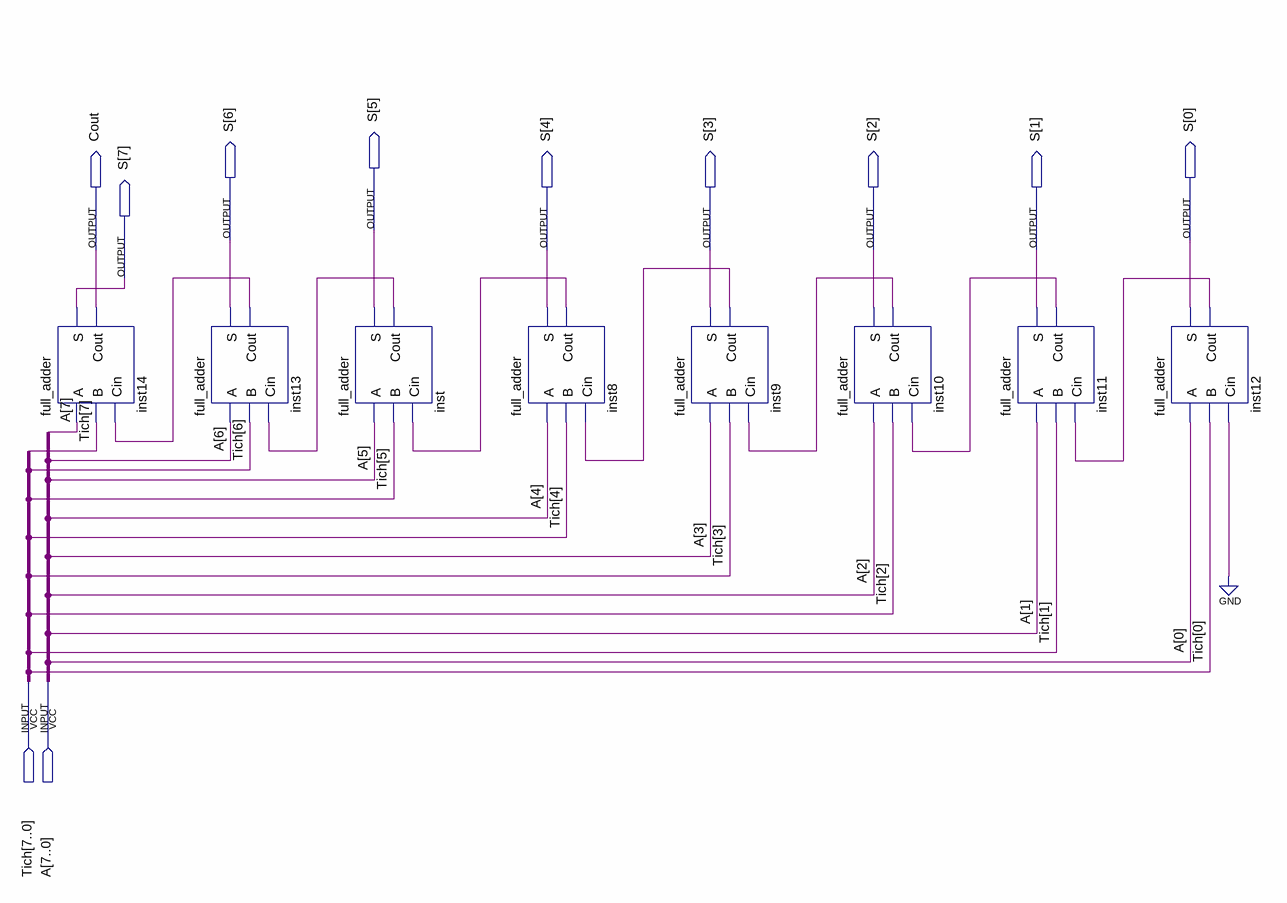
[diagram p0: schematic sheet]
// Quartus schematic full_adder_8bit.bdf as structural Verilog: 8 symbols, 11 pins
module full_adder_8bit (
  input  [7:0] Tich,
  input  [7:0] A,
  output [7:0] S,
  output Cout
);

  wire inst8_cout, inst9_cout, inst10_cout, inst11_cout, inst12_cout, inst13_cout, inst_cout;

  full_adder inst14 (.A(A[7]), .B(Tich[7]), .Cin(inst13_cout), .S(S[7]), .Cout(Cout));
  full_adder inst13 (.A(A[6]), .B(Tich[6]), .Cin(inst_cout), .S(S[6]), .Cout(inst13_cout));
  full_adder inst (.A(A[5]), .B(Tich[5]), .Cin(inst8_cout), .S(S[5]), .Cout(inst_cout));
  full_adder inst8 (.A(A[4]), .B(Tich[4]), .Cin(inst9_cout), .S(S[4]), .Cout(inst8_cout));
  full_adder inst9 (.A(A[3]), .B(Tich[3]), .Cin(inst10_cout), .S(S[3]), .Cout(inst9_cout));
  full_adder inst10 (.A(A[2]), .B(Tich[2]), .Cin(inst11_cout), .S(S[2]), .Cout(inst10_cout));
  full_adder inst11 (.A(A[1]), .B(Tich[1]), .Cin(inst12_cout), .S(S[1]), .Cout(inst11_cout));
  full_adder inst12 (.A(A[0]), .B(Tich[0]), .Cin(1'b0), .S(S[0]), .Cout(inst12_cout));
endmodule
